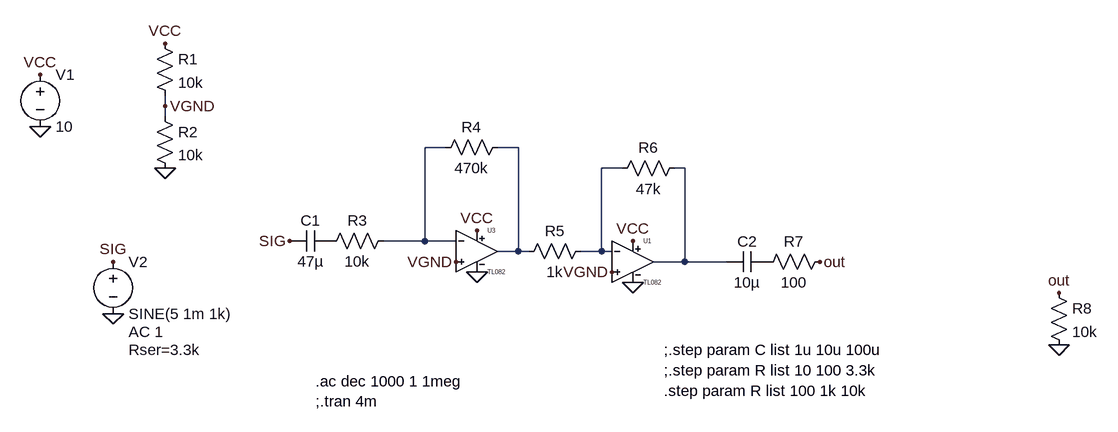
[diagram p0: schematic microphone_opamp_amplifier.asc]
microphone_opamp_amplifier.asc, the LTspice schematic file:
Version 4
SHEET 1 1416 680
WIRE -64 -16 -64 -32
WIRE -64 0 -64 -16
WIRE 368 48 336 48
WIRE 480 48 448 48
WIRE 640 80 608 80
WIRE 736 80 720 80
WIRE 336 192 336 48
WIRE 336 192 272 192
WIRE 384 192 336 192
WIRE 480 208 480 48
WIRE 480 208 448 208
WIRE 496 208 480 208
WIRE 608 208 608 80
WIRE 608 208 576 208
WIRE 624 208 608 208
WIRE 736 224 736 80
WIRE 736 224 688 224
WIRE 800 224 736 224
FLAG -256 16 0
FLAG -256 -64 VCC
FLAG -64 80 0
FLAG -64 -112 VCC
FLAG -64 -16 VGND
FLAG 416 176 VCC
FLAG 656 192 VCC
FLAG 416 240 0
FLAG 656 256 0
FLAG 384 224 VGND
FLAG 624 240 VGND
FLAG -144 304 0
FLAG -144 224 SIG
FLAG 944 224 out
FLAG 128 192 SIG
FLAG 1312 352 0
FLAG 1312 272 out
SYMBOL voltage -256 -80 R0
WINDOW 123 0 0 Left 0
WINDOW 39 0 0 Left 0
SYMATTR InstName V1
SYMATTR Value 10
SYMBOL res -80 -128 R0
SYMATTR InstName R1
SYMATTR Value 10k
SYMBOL res -80 -16 R0
SYMATTR InstName R2
SYMATTR Value 10k
SYMBOL voltage -144 208 R0
WINDOW 123 24 124 Left 2
WINDOW 39 24 152 Left 2
SYMATTR Value2 AC 1
SYMATTR SpiceLine Rser=3.3k
SYMATTR InstName V2
SYMATTR Value SINE(5 1m 1k)
SYMBOL cap 192 176 R90
WINDOW 0 0 32 VBottom 2
WINDOW 3 32 32 VTop 2
SYMATTR InstName C1
SYMATTR Value 47µ
SYMBOL res 288 176 R90
WINDOW 0 0 56 VBottom 2
WINDOW 3 32 56 VTop 2
SYMATTR InstName R3
SYMATTR Value 10k
SYMBOL res 464 32 R90
WINDOW 0 0 56 VBottom 2
WINDOW 3 32 56 VTop 2
SYMATTR InstName R4
SYMATTR Value 470k
SYMBOL res 592 192 R90
WINDOW 0 0 56 VBottom 2
WINDOW 3 32 56 VTop 2
SYMATTR InstName R5
SYMATTR Value 1k
SYMBOL res 736 64 R90
WINDOW 0 0 56 VBottom 2
WINDOW 3 32 56 VTop 2
SYMATTR InstName R6
SYMATTR Value 47k
SYMBOL res 960 208 R90
WINDOW 0 0 56 VBottom 2
WINDOW 3 32 56 VTop 2
SYMATTR InstName R7
SYMATTR Value 100
SYMBOL cap 864 208 R90
WINDOW 0 0 32 VBottom 2
WINDOW 3 32 32 VTop 2
SYMATTR InstName C2
SYMATTR Value 10µ
SYMBOL res 1296 256 R0
SYMATTR InstName R8
SYMATTR Value 10k
SYMBOL my\\TL082 416 144 R0
SYMATTR InstName U3
SYMBOL my\\TL082 656 160 R0
SYMATTR InstName U1
TEXT 168 408 Left 2 !.ac dec 1000 1 1meg\n;.tran 4m
TEXT 704 360 Left 2 !;.step param C list 1u 10u 100u\n;.step param R list 10 100 3.3k\n.step param R list 100 1k 10k

The netlist it stands for:
* microphone_opamp_amplifier.asc
V1 VCC 0 10
R1 VCC VGND 10k
R2 VGND 0 10k
V2 SIG 0 SINE(5 1m 1k) AC 1 Rser=3.3k
C1 P001 SIG 47µ
R3 N001 P001 10k
R4 N002 N001 470k
R5 N003 N002 1k
R6 N004 N003 47k
R7 out P002 100
C2 P002 N004 10µ
R8 out 0 10k
XU3 VGND N001 VCC 0 N002 TL082  ; pins IN+ IN- VCC VEE OUT
XU1 VGND N003 VCC 0 N004 TL082  ; pins IN+ IN- VCC VEE OUT
.ac dec 1000 1 1meg
;.tran 4m
;.step param C list 1u 10u 100u
;.step param R list 10 100 3.3k
.step param R list 100 1k 10k
.lib TL082.sub
.backanno
.end